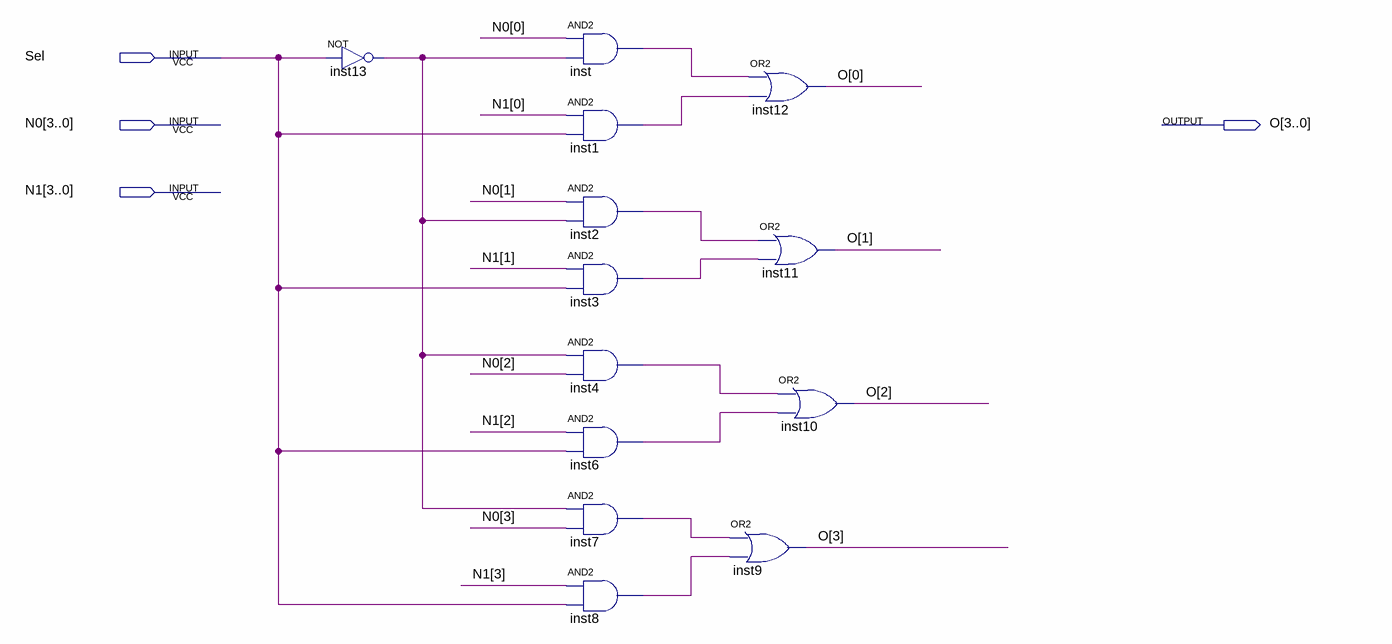
[diagram p0: schematic sheet]
// Quartus schematic MUXbdf.bdf as structural Verilog: 13 symbols, 4 pins
module MUXbdf (
  input  Sel,
  input  [3:0] N0,
  input  [3:0] N1,
  output [3:0] O
);

  wire inst1_out, inst2_out, inst3_out, inst4_out, inst6_out, inst7_out, inst8_out, inst13_out, inst_out;

  not inst13 (inst13_out, Sel);
  and inst (inst_out, N0[0], inst13_out);
  and inst1 (inst1_out, N1[0], Sel);
  and inst2 (inst2_out, N0[1], inst13_out);
  and inst3 (inst3_out, N1[1], Sel);
  and inst4 (inst4_out, inst13_out, N0[2]);
  and inst6 (inst6_out, N1[2], Sel);
  and inst7 (inst7_out, inst13_out, N0[3]);
  and inst8 (inst8_out, N1[3], Sel);
  or inst12 (O[0], inst_out, inst1_out);
  or inst11 (O[1], inst2_out, inst3_out);
  or inst10 (O[2], inst4_out, inst6_out);
  or inst9 (O[3], inst7_out, inst8_out);
endmodule
